# Altium schematic sheet imu.SchDoc
size A4
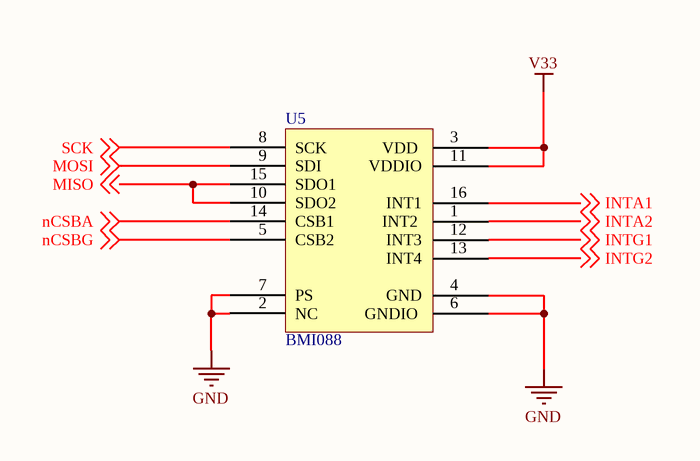
[diagram p0: imu.SchDoc]

## Parts
U5  BMI088  [BMI088]

## Nets
GND: U5.2(NC) U5.4(GND) U5.6(GNDIO) U5.7(PS)
V33: U5.3(VDD) U5.11(VDDIO)
INTA1: U5.16(INT1) ; off-sheet INTA1
INTA2: U5.1(INT2) ; off-sheet INTA2
INTG1: U5.12(INT3) ; off-sheet INTG1
INTG2: U5.13(INT4) ; off-sheet INTG2
MISO: U5.10(SDO2) U5.15(SDO1) ; off-sheet MISO
MOSI: U5.9(SDI) ; off-sheet MOSI
nCSBA: U5.14(CSB1) ; off-sheet nCSBA
nCSBG: U5.5(CSB2) ; off-sheet nCSBG
SCK: U5.8(SCK) ; off-sheet SCK